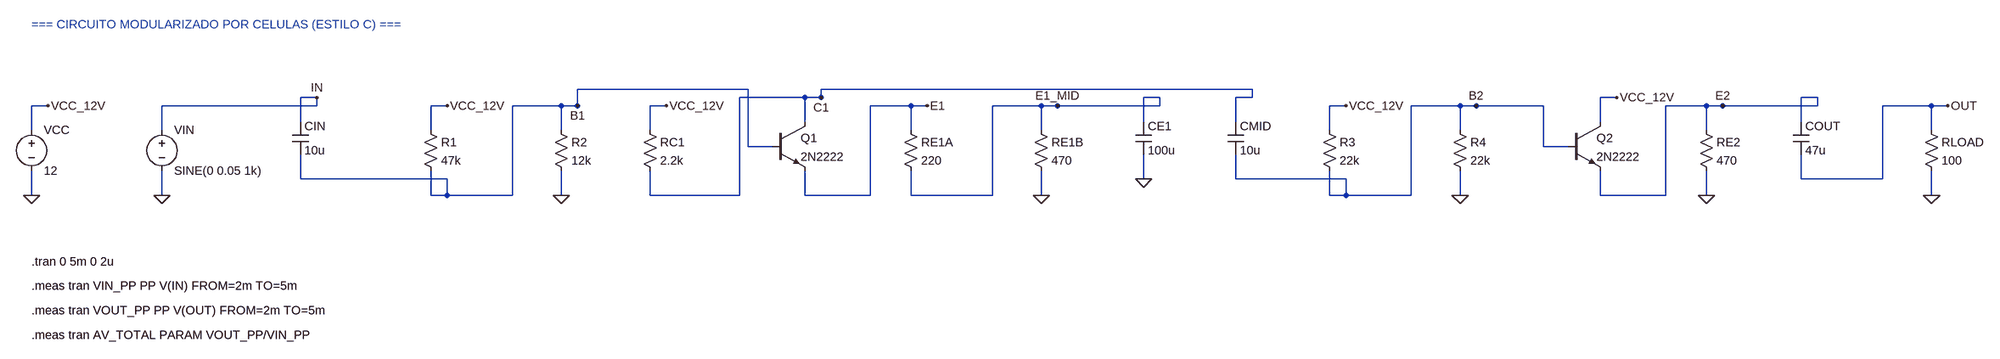
[diagram p0: schematic estilo_C_modular_blocks.asc]
estilo_C_modular_blocks.asc, the LTspice schematic file:
Version 4
SHEET 1 5376 960
WIRE 96 256 96 208
WIRE 96 208 128 208
WIRE 96 336 96 384
WIRE 352 256 352 208
WIRE 352 208 384 208
WIRE 352 336 352 384
WIRE 624 240 624 192
WIRE 624 192 656 192
WIRE 624 304 624 352
WIRE 624 352 656 352
WIRE 880 256 880 208
WIRE 880 208 912 208
WIRE 880 336 880 384
WIRE 880 384 912 384
WIRE 1136 256 1136 208
WIRE 1136 208 1168 208
WIRE 1136 336 1136 384
WIRE 1392 256 1392 208
WIRE 1392 208 1424 208
WIRE 1392 336 1392 384
WIRE 1392 384 1424 384
WIRE 1696 240 1696 192
WIRE 1696 192 1728 192
WIRE 1632 288 1584 288
WIRE 1696 336 1696 384
WIRE 1696 384 1728 384
WIRE 1904 256 1904 208
WIRE 1904 208 1936 208
WIRE 1904 336 1904 384
WIRE 1904 384 1936 384
WIRE 2160 256 2160 208
WIRE 2160 208 2192 208
WIRE 2160 336 2160 384
WIRE 2416 240 2416 192
WIRE 2416 192 2448 192
WIRE 2416 304 2416 352
WIRE 2672 240 2672 192
WIRE 2672 192 2704 192
WIRE 2672 304 2672 352
WIRE 2672 352 2704 352
WIRE 2928 256 2928 208
WIRE 2928 208 2960 208
WIRE 2928 336 2928 384
WIRE 2928 384 2960 384
WIRE 3184 256 3184 208
WIRE 3184 208 3216 208
WIRE 3184 336 3184 384
WIRE 3488 240 3488 192
WIRE 3488 192 3520 192
WIRE 3424 288 3376 288
WIRE 3488 336 3488 384
WIRE 3488 384 3520 384
WIRE 3696 256 3696 208
WIRE 3696 208 3728 208
WIRE 3696 336 3696 384
WIRE 3952 240 3952 192
WIRE 3952 192 3984 192
WIRE 3952 304 3952 352
WIRE 3952 352 3984 352
WIRE 4208 256 4208 208
WIRE 4208 208 4240 208
WIRE 4208 336 4208 384
WIRE 384 208 656 208
WIRE 656 208 656 192
WIRE 1728 384 1824 384
WIRE 1824 384 1824 208
WIRE 1824 208 1936 208
WIRE 3984 352 4112 352
WIRE 4112 352 4112 208
WIRE 4112 208 4240 208
WIRE 3520 384 3616 384
WIRE 3616 384 3616 208
WIRE 3616 208 3728 208
WIRE 3728 208 3984 208
WIRE 3984 208 3984 192
WIRE 1936 384 2064 384
WIRE 2064 384 2064 208
WIRE 2064 208 2192 208
WIRE 2192 208 2448 208
WIRE 2448 208 2448 192
WIRE 2704 352 2960 352
WIRE 2960 352 2960 384
WIRE 2960 384 3088 384
WIRE 3088 384 3088 208
WIRE 3088 208 3216 208
WIRE 3216 208 3376 208
WIRE 3376 208 3376 288
WIRE 656 352 912 352
WIRE 912 352 912 384
WIRE 912 384 1040 384
WIRE 1040 384 1040 208
WIRE 1040 208 1168 208
WIRE 1168 208 1168 176
WIRE 1168 176 1584 176
WIRE 1584 176 1584 288
WIRE 1424 384 1568 384
WIRE 1568 384 1568 192
WIRE 1568 192 1728 192
WIRE 1728 192 1728 176
WIRE 1728 176 2704 176
WIRE 2704 176 2704 192
FLAG 128 208 VCC_12V
FLAG 96 384 0
FLAG 352 384 0
FLAG 656 192 IN
FLAG 912 208 VCC_12V
FLAG 1168 208 B1
FLAG 1136 384 0
FLAG 1424 208 VCC_12V
FLAG 1728 192 C1
FLAG 1936 208 E1
FLAG 2192 208 E1_MID
FLAG 2160 384 0
FLAG 2416 352 0
FLAG 2960 208 VCC_12V
FLAG 3216 208 B2
FLAG 3184 384 0
FLAG 3520 192 VCC_12V
FLAG 3728 208 E2
FLAG 3696 384 0
FLAG 4240 208 OUT
FLAG 4208 384 0
SYMBOL voltage 96 240 R0
WINDOW 3 24 96 Left 2
SYMATTR InstName VCC
SYMATTR Value 12
SYMBOL voltage 352 240 R0
WINDOW 3 24 96 Left 2
SYMATTR InstName VIN
SYMATTR Value SINE(0 0.05 1k)
SYMBOL cap 608 240 R0
SYMATTR InstName CIN
SYMATTR Value 10u
SYMBOL res 864 240 R0
SYMATTR InstName R1
SYMATTR Value 47k
SYMBOL res 1120 240 R0
SYMATTR InstName R2
SYMATTR Value 12k
SYMBOL res 1376 240 R0
SYMATTR InstName RC1
SYMATTR Value 2.2k
SYMBOL npn 1632 240 R0
SYMATTR InstName Q1
SYMATTR Value 2N2222
SYMBOL res 1888 240 R0
SYMATTR InstName RE1A
SYMATTR Value 220
SYMBOL res 2144 240 R0
SYMATTR InstName RE1B
SYMATTR Value 470
SYMBOL cap 2400 240 R0
SYMATTR InstName CE1
SYMATTR Value 100u
SYMBOL cap 2656 240 R0
SYMATTR InstName CMID
SYMATTR Value 10u
SYMBOL res 2912 240 R0
SYMATTR InstName R3
SYMATTR Value 22k
SYMBOL res 3168 240 R0
SYMATTR InstName R4
SYMATTR Value 22k
SYMBOL npn 3424 240 R0
SYMATTR InstName Q2
SYMATTR Value 2N2222
SYMBOL res 3680 240 R0
SYMATTR InstName RE2
SYMATTR Value 470
SYMBOL cap 3936 240 R0
SYMATTR InstName COUT
SYMATTR Value 47u
SYMBOL res 4192 240 R0
SYMATTR InstName RLOAD
SYMATTR Value 100
TEXT 96 48 Left 2 ;=== CIRCUITO MODULARIZADO POR CELULAS (ESTILO C) ===
TEXT 96 544 Left 2 !.tran 0 5m 0 2u
TEXT 96 592 Left 2 !.meas tran VIN_PP PP V(IN) FROM=2m TO=5m
TEXT 96 640 Left 2 !.meas tran VOUT_PP PP V(OUT) FROM=2m TO=5m
TEXT 96 688 Left 2 !.meas tran AV_TOTAL PARAM VOUT_PP/VIN_PP

The netlist it stands for:
* estilo_C_modular_blocks.asc
VCC VCC_12V 0 12
VIN IN 0 SINE(0 0.05 1k)
CIN IN B1 10u
R1 VCC_12V B1 47k
R2 B1 0 12k
RC1 VCC_12V C1 2.2k
Q1 C1 B1 E1 0 2N2222
RE1A E1 E1_MID 220
RE1B E1_MID 0 470
CE1 E1_MID 0 100u
CMID C1 B2 10u
R3 VCC_12V B2 22k
R4 B2 0 22k
Q2 VCC_12V B2 E2 0 2N2222
RE2 E2 0 470
COUT E2 OUT 47u
RLOAD OUT 0 100
.model NPN NPN
.model PNP PNP
.lib standard.bjt
* === CIRCUITO MODULARIZADO POR CELULAS (ESTILO C) ===
.tran 0 5m 0 2u
.meas tran VIN_PP PP V(IN) FROM=2m TO=5m
.meas tran VOUT_PP PP V(OUT) FROM=2m TO=5m
.meas tran AV_TOTAL PARAM VOUT_PP/VIN_PP
.backanno
.end